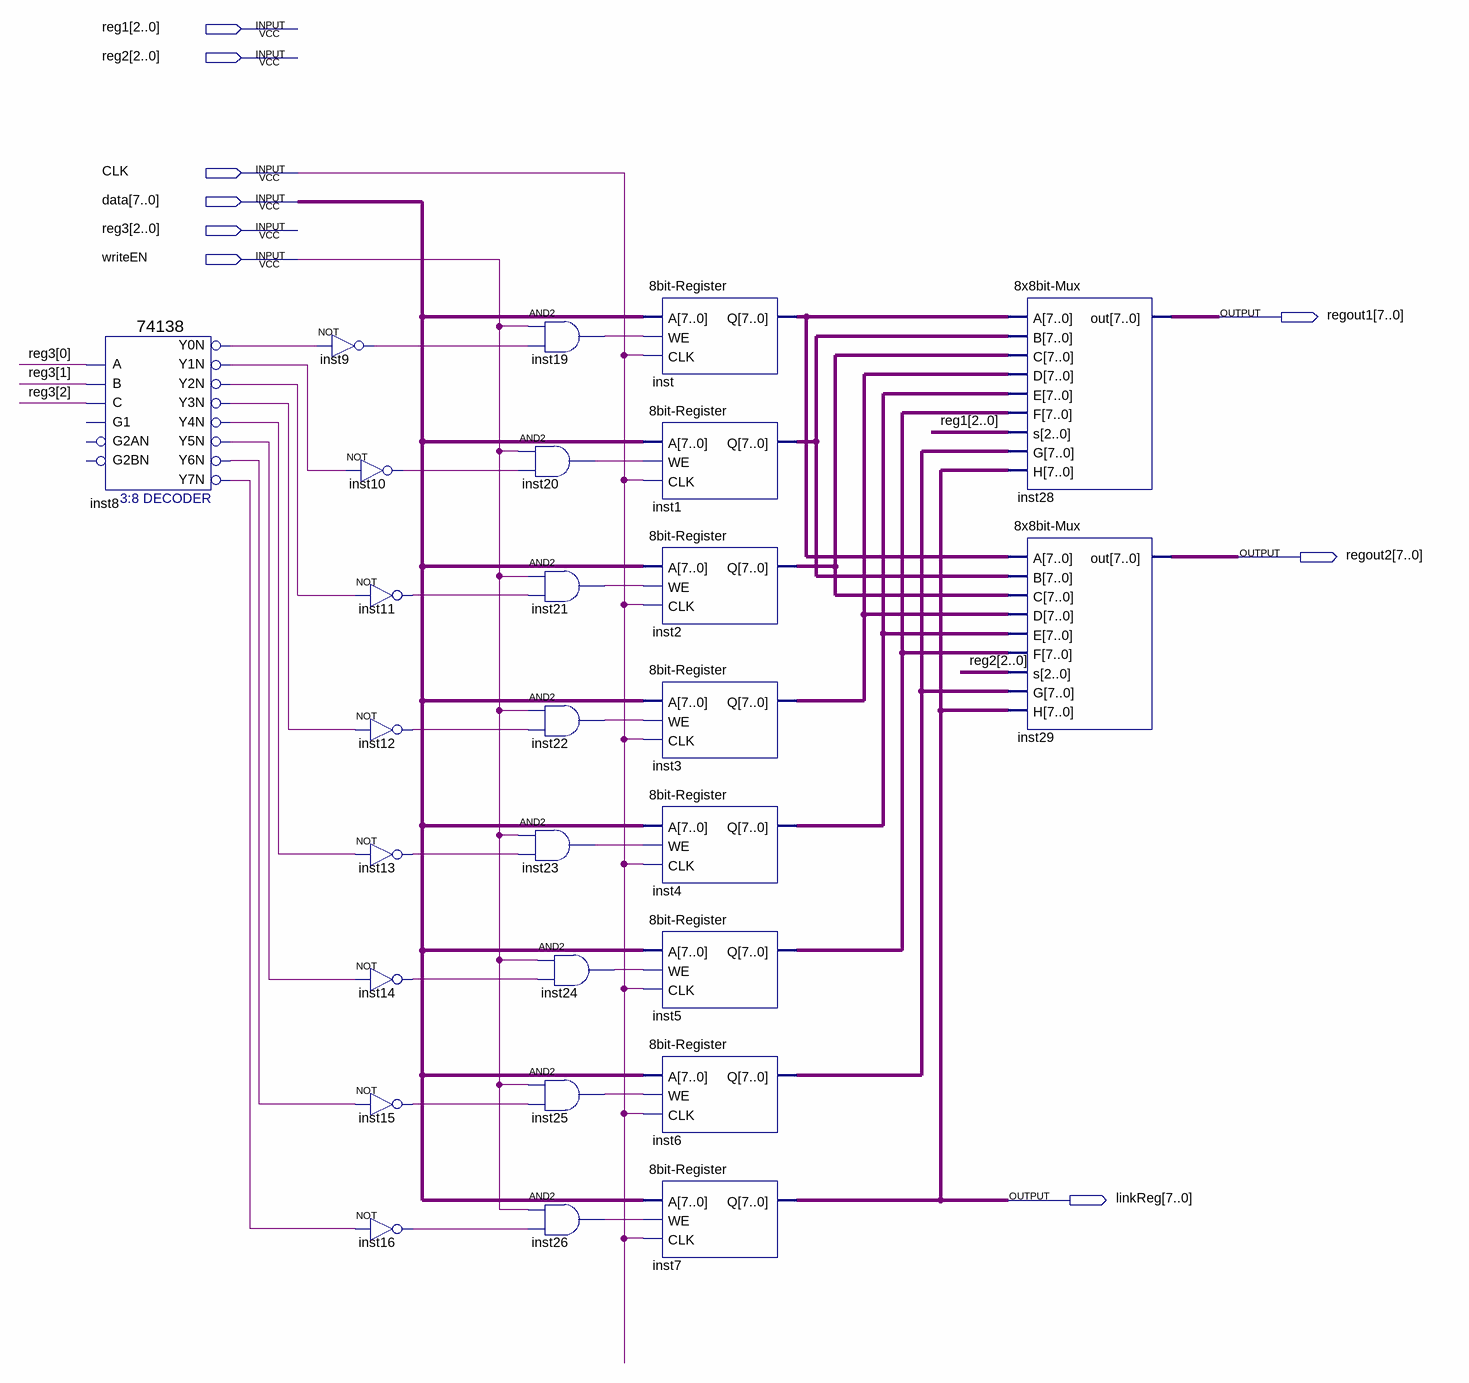
[diagram p0: schematic sheet]
// Quartus schematic RegisterFile.bdf as structural Verilog: 27 symbols, 9 pins
module RegisterFile (
  input  [2:0] reg1,
  input  [2:0] reg2,
  input  CLK,
  input  [7:0] data,
  input  [2:0] reg3,
  input  writeEN,
  output [7:0] regout1,
  output [7:0] regout2,
  output [7:0] linkReg
);

  wire inst8_y0n, inst8_y1n, inst8_y2n, inst8_y3n, inst8_y4n, inst8_y5n, inst8_y6n, inst8_y7n, inst9_out,
       inst10_out, inst11_out, inst12_out, inst13_out, inst14_out, inst15_out, inst16_out, inst19_out,
       inst20_out, inst21_out, inst22_out, inst23_out, inst24_out, inst25_out, inst26_out;
  wire [7:0] inst1_q, inst2_q, inst3_q, inst4_q, inst5_q, inst6_q, inst_q;

  \74138  inst8 (
    .A(reg3[0]), .B(reg3[1]), .C(reg3[2]), .Y0N(inst8_y0n), .Y1N(inst8_y1n), .Y2N(inst8_y2n),
    .Y3N(inst8_y3n), .Y4N(inst8_y4n), .Y5N(inst8_y5n), .Y6N(inst8_y6n), .Y7N(inst8_y7n));  // open: G1, G2AN, G2BN
  not inst9 (inst9_out, inst8_y0n);
  not inst10 (inst10_out, inst8_y1n);
  not inst11 (inst11_out, inst8_y2n);
  not inst12 (inst12_out, inst8_y3n);
  not inst13 (inst13_out, inst8_y4n);
  not inst14 (inst14_out, inst8_y5n);
  not inst15 (inst15_out, inst8_y6n);
  not inst16 (inst16_out, inst8_y7n);
  and inst19 (inst19_out, writeEN, inst9_out);
  and inst20 (inst20_out, writeEN, inst10_out);
  and inst21 (inst21_out, writeEN, inst11_out);
  and inst22 (inst22_out, writeEN, inst12_out);
  and inst23 (inst23_out, writeEN, inst13_out);
  and inst24 (inst24_out, writeEN, inst14_out);
  and inst25 (inst25_out, writeEN, inst15_out);
  and inst26 (inst26_out, writeEN, inst16_out);
  \8bit-Register  inst (.A(data), .WE(inst19_out), .CLK(CLK), .Q(inst_q));
  \8bit-Register  inst1 (.A(data), .WE(inst20_out), .CLK(CLK), .Q(inst1_q));
  \8bit-Register  inst2 (.A(data), .WE(inst21_out), .CLK(CLK), .Q(inst2_q));
  \8bit-Register  inst3 (.A(data), .WE(inst22_out), .CLK(CLK), .Q(inst3_q));
  \8bit-Register  inst4 (.A(data), .WE(inst23_out), .CLK(CLK), .Q(inst4_q));
  \8bit-Register  inst5 (.A(data), .WE(inst24_out), .CLK(CLK), .Q(inst5_q));
  \8bit-Register  inst6 (.A(data), .WE(inst25_out), .CLK(CLK), .Q(inst6_q));
  \8bit-Register  inst7 (.A(data), .WE(inst26_out), .CLK(CLK), .Q(linkReg));
  \8x8bit-Mux  inst28 (
    .A(inst_q), .B(inst1_q), .C(inst2_q), .D(inst3_q), .E(inst4_q), .F(inst5_q), .s(reg1), .G(inst6_q),
    .H(linkReg), .out(regout1));
  \8x8bit-Mux  inst29 (
    .A(inst_q), .B(inst1_q), .C(inst2_q), .D(inst3_q), .E(inst4_q), .F(inst5_q), .s(reg2), .G(inst6_q),
    .H(linkReg), .out(regout2));
endmodule
